# Altium schematic sheet Do_an_2.SchDoc
size 400 x 190 mm; SheetNumber: 1; SheetTotal: 2
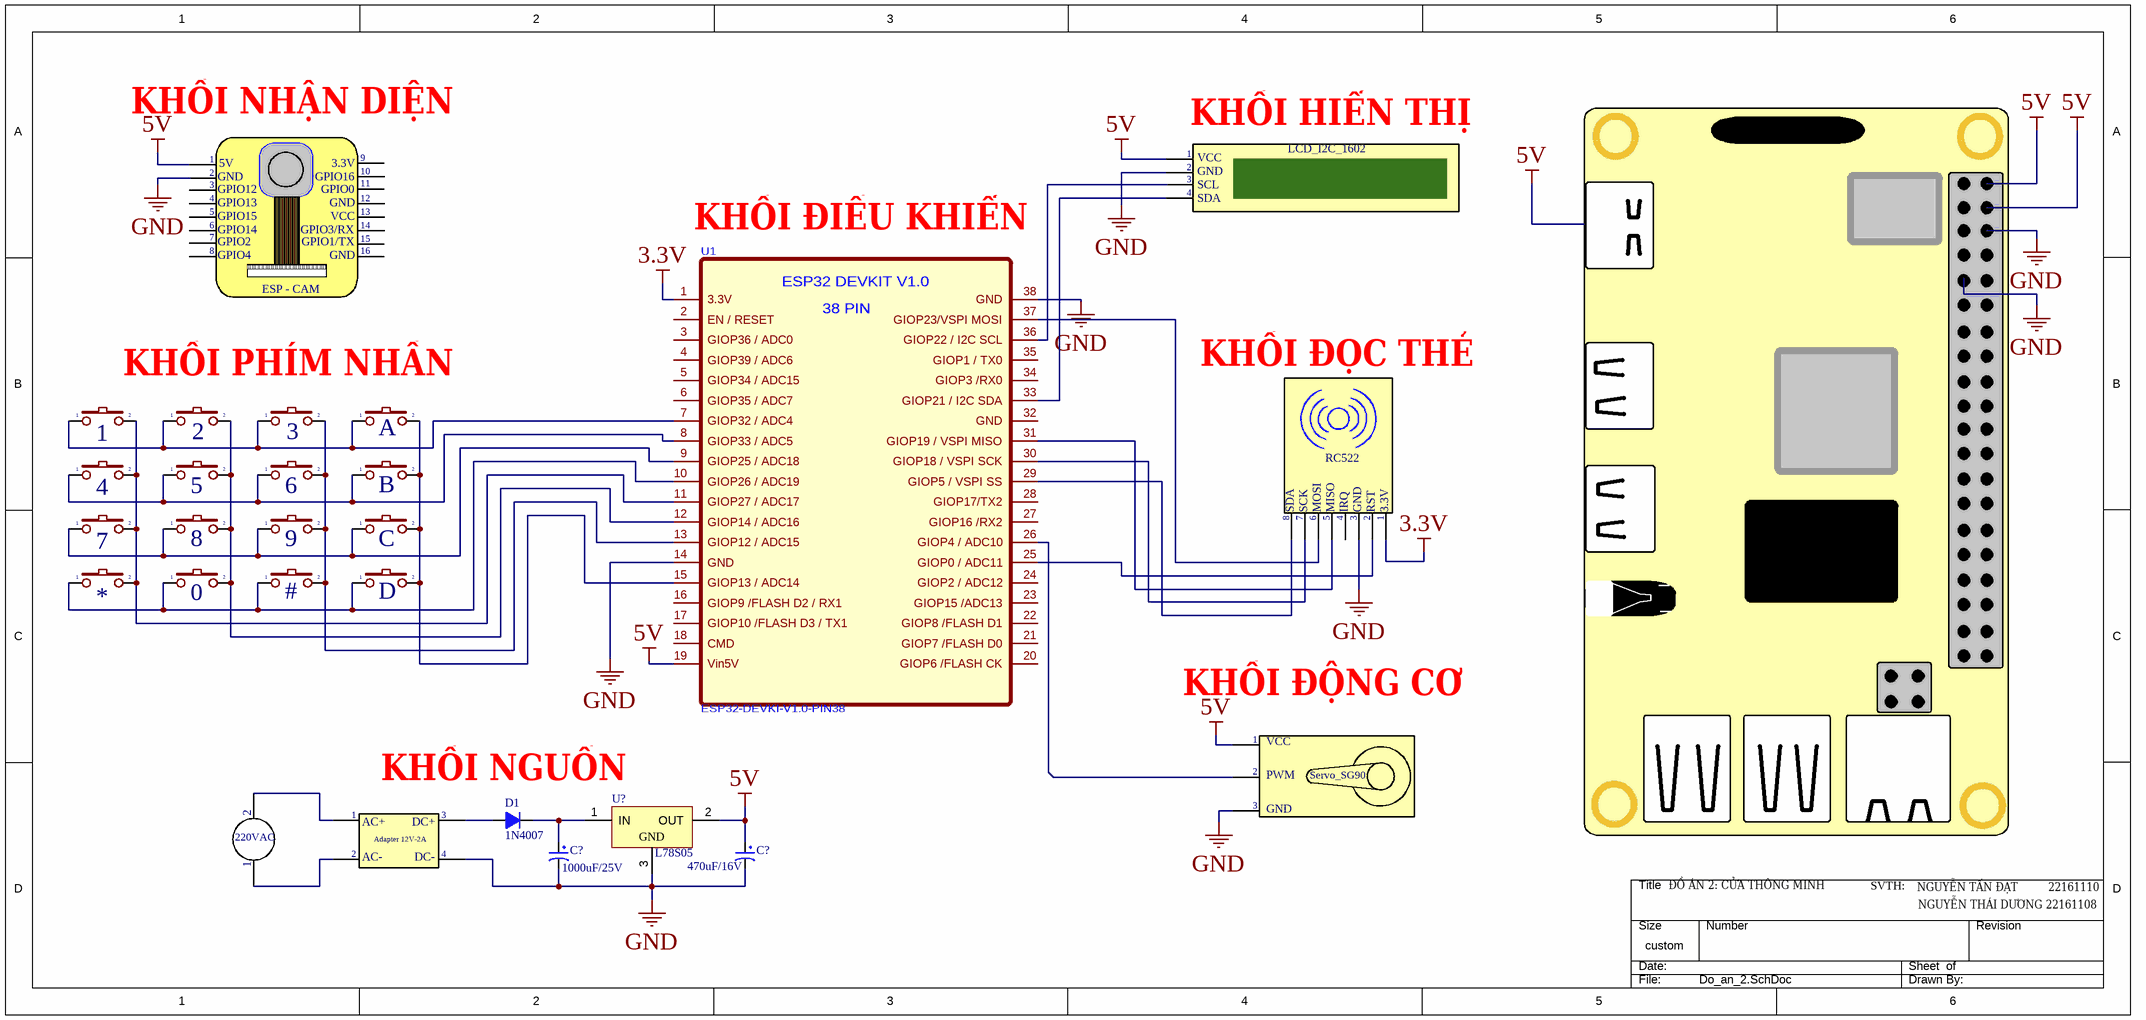
[diagram p0: Do_an_2.SchDoc]

## Parts
(Parts that share a designator on the sheet are numbered #1, #2 ... from top to bottom, then left to right.)
0  SW  [SW2]  (value not drawn)
1  SW  [SW2]  (value not drawn)
2  SW  [SW2]  (value not drawn)
3  SW  [SW2]  (value not drawn)
4  SW  [SW2]  (value not drawn)
5  SW  [SW2]  (value not drawn)
6  SW  [SW2]  (value not drawn)
7  SW  [SW2]  (value not drawn)
8  SW  [SW2]  (value not drawn)
9  SW  [SW2]  (value not drawn)
#  SW  [SW2]  (value not drawn)
*  SW  [SW2]  (value not drawn)
A  SW  [SW2]  (value not drawn)
B  SW  [SW2]  (value not drawn)
C  SW  [SW2]  (value not drawn)
C?#1  1000uF/25V  [CP4.5/19]
C?#2  470uF/16V  [CP4.5/19]
D  SW  [SW2]  (value not drawn)
D1  1N4007  [DIODE 1A]
U1  ESP32-DEVKI-V1.0-PIN38  [ESP32-DEVKIT-V1.0-38PIN]
U?  L78S05  [HDR1x3 BIG]

## Nets
3.3V: U1.1(3.3V)
5V: C?#2.1 U1.19(Vin5V) U?.2(OUT)
GND: C?#1.2 C?#2.2 U1.14(GND) U1.38(GND) U?.3(GND)
Net0_1: 0.1 #.1 *.1 D.1 U1.10(GIOP26_/_ADC19)
Net0_2: 0.2 2.2 5.2 8.2 U1.12(GIOP14_/_ADC16)
Net1_1: 1.1 2.1 3.1 A.1 U1.7(GIOP32_/_ADC4)
Net1_2: 1.2 4.2 7.2 *.2 U1.11(GIOP27_/_ADC17)
Net3_2: 3.2 6.2 9.2 #.2 U1.13(GIOP12_/_ADC15)
Net4_1: 4.1 5.1 6.1 B.1 U1.8(GIOP33_/_ADC5)
Net7_1: 7.1 8.1 9.1 C.1 U1.9(GIOP25_/_ADC18)
NetA_2: A.2 B.2 C.2 D.2 U1.15(GIOP13_/_ADC14)
NetC?#1_1: C?#1.1 D1.2(K) U?.1(IN)

Not connected (* = marked no-connect by the designer): D1 1(A); U1 2(EN_/_RESET) 3(GIOP36_/_ADC0) 4(GIOP39_/_ADC6) 5(GIOP34_/_ADC15) 6(GIOP35_/_ADC7) 16(GIOP9_/FLASH_D2_/_RX1) 17(GIOP10_/FLASH_D3_/_TX1) 18(CMD) 20(GIOP6_/FLASH_CK) 21(GIOP7_/FLASH_D0) 22(GIOP8_/FLASH_D1) 23(GIOP15_/ADC13) 24(GIOP2_/_ADC12) 25(GIOP0_/_ADC11) 26(GIOP4_/_ADC10) 27(GIOP16_/RX2) 28(GIOP17/TX2) 29(GIOP5_/_VSPI_SS) 30(GIOP18_/_VSPI_SCK) 31(GIOP19_/_VSPI_MISO) 32(GND) 33(GIOP21_/_I2C_SDA) 34(GIOP3_/RX0) 35(GIOP1_/_TX0) 36(GIOP22_/_I2C_SCL) 37(GIOP23/VSPI_MOSI)

## Notes on the sheet
- KHỐI NHẬN DIỆN
- 1
- 9
- KHỐI HIỂN THỊ
- VCC
- LCD_I2C_1602
- 6
- 5
- 4
- 3
- 2
- GND
- GPIO12
- GPIO13
- GPIO15
- GPIO14
- 5V
- GPIO3/RX
- GPIO16
- GPIO0
- 3.3V
- 14
- 13
- 12
- 11
- 10
- KHỐI ĐIỀU KHIỂN
- SCL
- SDA
- 8
- 7
- GPIO2
- GPIO4
- ESP - CAM
- GPIO1/TX
- 16
- 15
- KHỐI PHÍM NHẤN
- KHỐI ĐỌC THẺ
- RC522
- SCK
- MOSI
- MISO
- IRQ
- RST
- KHỐI ĐỘNG CƠ
- 220VAC
- AC+
- Adapter 12V-2A
- (near D1) KHỐI NGUỒN
- DC+
- PWM
- Servo_SG90
- AC-
- DC-
- ĐỒ ÁN 2: CỬA THÔNG MINH
- SVTH:
- NGUYỄN TẤN ĐẠT         22161110
- NGUYỄN THÁI DƯƠNG 22161108
- THIS DOCUMENT AND THE DATA DISCLOSED HEREIN OR
- HEREWITH IS THE PROPERTY OF ALTIUM LIMITED AND MAY
- DWG NO:
- REVISION
- REV:
- DESCRIPTION
- DATE
- APPROVED
- BE FREELY DISTRIBUTED IN WHOLE. NO RIGHTS ARE
- RESERVED OR EXPRESS OR IMPLIED WARANTEE GIVEN.
- ENG:
- APPROVALS
- PROJECT
- DSN:
- CHK:
- REFERENCE DOCUMENTS
- PROJECT REVISION:
- TITLE
- DOCUMENT REVISION:
- DESIGN ITEM:
- BOM:
- FAB DWG:
- PCB DWG:
- ASSY DWG:
- SCALE:
- A3
- SIZE
- CAGE CODE
- FILE NAME
- DWG NO.
- SHEET
- OF
- REV
- (in symbol ESP32-DEVKI-V1.0-PIN38) ESP32 DEVKIT V1.0; 38 PIN

## Library data of the parts
0-9 # * A B C D = SW2: Switch button 2 pin; Value: SW chip 2 pin
C?#1 C?#2 = CP9: Cap 10000uF/63V; Value: 220uF/450V
D1 = Diode 1N4007: Cắm; Ten_Linh_Kien: Diode 1N4007 1A (DIP); Don_Vi: Con; Ma_Hang: MH001063; Ghi Chu: *; Kieu_Chan: *; Chung_Loai: Cắm
U? = L78M09CX: Positive Voltage Regulator; Note: Tab is connected to pin 3 (GND).; Published: 24-Aug-2001; LatestRevisionDate: 17-Jul-2002; LatestRevisionNote: Re-released for DXP Platform.; DatasheetVersion: Apr-1994; PackageReference: SOT82C; Publisher: Altium Limited; PackageDescription: SIP; 3 Leads; Body 10.9 x 7.6 x 2.6 mm (typ); Pitch 2.2 mm; ComponentLink1Description: Manufacturer Link; ComponentLink1URL: http://www.st.com/; ComponentLink2Description: Datasheet; ComponentLink2URL: http://www.st.com/stonline/products/literature/ds/2146/l78m05c.pdf